# Altium schematic sheet 100_AC-DC.SchDoc: AC-DC convertion stage
size A4; Date: XXXXXX; Author: Y.Gonzalez; Revision: R1V0; SheetNumber: 2; SheetTotal: 5
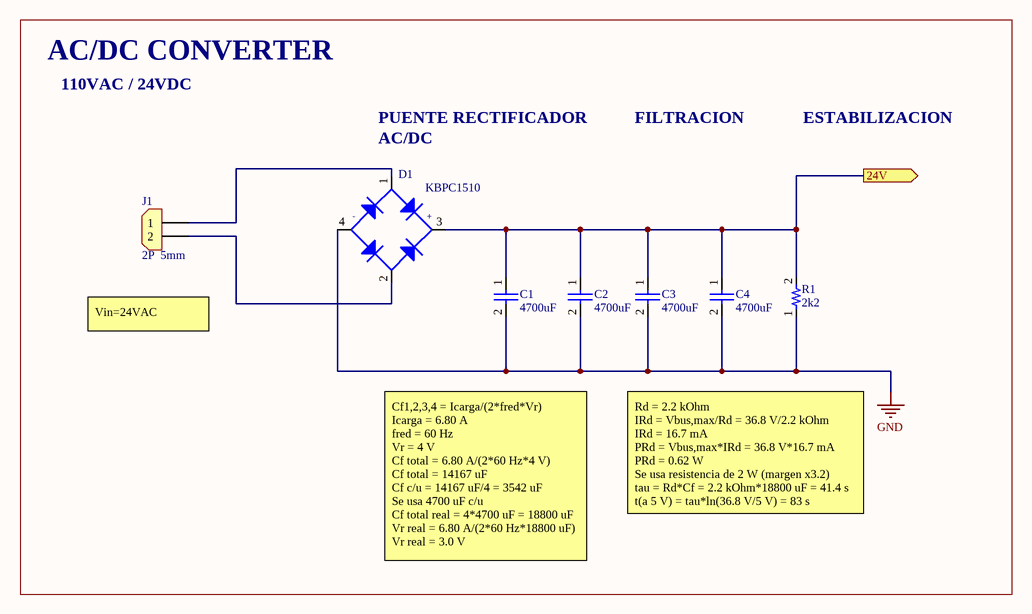
[diagram p0: 100_AC-DC.SchDoc]

## Parts
C1  value 4700uF  [CAP_4700uF_50V]  (hidden comment: 50USC4700MEFCSN22X35)
C2  value 4700uF  [CAP_4700uF_50V]  (hidden comment: 50USC4700MEFCSN22X35)
C3  value 4700uF  [CAP_4700uF_50V]  (hidden comment: 50USC4700MEFCSN22X35)
C4  value 4700uF  [CAP_4700uF_50V]  (hidden comment: 50USC4700MEFCSN22X35)
D1  KBPC1510  [KBPC8]
J1  2P  5mm  [CON_2x1_TH_5mm]
R1  value 2k2  [Res_2K2_2W_TH]

## Ports
24V (out)

## Nets
GND: C1.2 C2.2 C3.2 C4.2 D1.4 R1.1
24V: C1.1 C2.1 C3.1 C4.1 D1.3 R1.2 ; port 24V
NetD1_1: D1.1 J1.1
NetD1_2: D1.2 J1.2

## Notes on the sheet
- AC/DC CONVERTER
- 110VAC / 24VDC
- PUENTE RECTIFICADOR
- (near D1) AC/DC
- FILTRACION
- ESTABILIZACION
- Vin=24VAC
- Cf1,2,3,4 = Icarga/(2*fred*Vr)
  Icarga = 6.80 A
  fred = 60 Hz
  Vr = 4 V
  Cf total = 6.80 A/(2*60 Hz*4 V)
  Cf total = 14167 uF
  Cf c/u = 14167 uF/4 = 3542 uF
  Se usa 4700 uF c/u
  Cf total real = 4*4700 uF = 18800 uF
  Vr real = 6.80 A/(2*60 Hz*18800 uF)
  Vr real = 3.0 V
- Rd = 2.2 kOhm
  IRd = Vbus,max/Rd = 36.8 V/2.2 kOhm
  IRd = 16.7 mA
  PRd = Vbus,max*IRd = 36.8 V*16.7 mA
  PRd = 0.62 W
  Se usa resistencia de 2 W (margen x3.2)
  tau = Rd*Cf = 2.2 kOhm*18800 uF = 41.4 s
  t(a 5 V) = tau*ln(36.8 V/5 V) = 83 s
- Title:
- Project:
- File:
- Revision:
- Date:
- Size:
- A4
- Drawn by:
- (in symbol BR_KBPC_1kV_15A) -; +

## Library data of the parts
C1-C4 = CAP_4700uF_50V: CAP ALUM 4700uF ±20% 50V TH; Manufacturer: Rubycon; Parameter 4: C338224; Manufacturer Part Number: 50USC4700MEFCSN22X35; Supplier 1: LCSC; Supplier Part Number 1: C338224; Last modified by: Y.Gonzalez; Last modified date: 24102026; ComponentLink1Description: datasheet; ComponentLink1URL: https://www.lcsc.com/datasheet/C338224.pdf; ComponentLink2Description: LCSC; ComponentLink2URL: https://www.lcsc.com/product-detail/C338224.html?s_z=n_q_t_4700%25C2%25B5F%2520%252050V
D1 = BR_KBPC_1kV_15A: BRIDGE RECT 1kV 15A KBPC; Manufacturer: YFW; Supplier 1: C19273102; Supplier Part Number 1: LCSC; Manufacturer Part Numbers: KBPC1510; Last modified by: Y.Gonzalez; Last modified date: 24102026; ComponentLink1Description: LCSC; ComponentLink1URL: https://www.lcsc.com/product-detail/C19273102.html?s_z=n_q_KBPC1510; ComponentLink2Description: DATASHEET; ComponentLink2URL: https://www.lcsc.com/datasheet/C19273102.pdf
J1 = Con_2x1_TH_5mm: TERM BLK 2POS SIDE ENTRY 5MM PCB; Manufacturer: Phoenix Contact; Manufacturer Part Number: 1935161; Supplier Part Number 1: 277-1667-ND; Last modified by: J.Jaramillo; Last modified date: 20240310; ComponentLink1Description: Digi-key; ComponentLink1URL: https://www.digikey.com/en/products/detail/phoenix-contact/1935161/568614; Reel Stock: N/A; Supplier 1: Digi-Key
R1 = Res_2K2_2W_TH: RES 2.2kΩ ±5% 2W Through Hole,D4.5xL11mm; Manufacturer: SEI(Stackpole Electronics Inc.); Manucfacturer Part Number 1: RSMF2JT2K20; Supplier: LCSC; Last modified by: Y.Gonzalez; Supplier Part Number 1: C2584336; Parameter 6: *; ComponentLink1Description: Datasheet; ComponentLink1URL: https://datasheet.octopart.com/RSMF2JT2K20-Stackpole-Electronics-datasheet-170576583.pdf; ComponentLink2Description: Ultralibrarian; ComponentLink2URL: https://app.ultralibrarian.com/details/3be72d1d-bf55-11e9-ab3a-0a3560a4cccc/Stackpole-International/RSMF2JT2K20?uid=19230567&exports=41; Last modified date: 25102026